# EAGLE design button_mux (EAGLE 9.6.2)
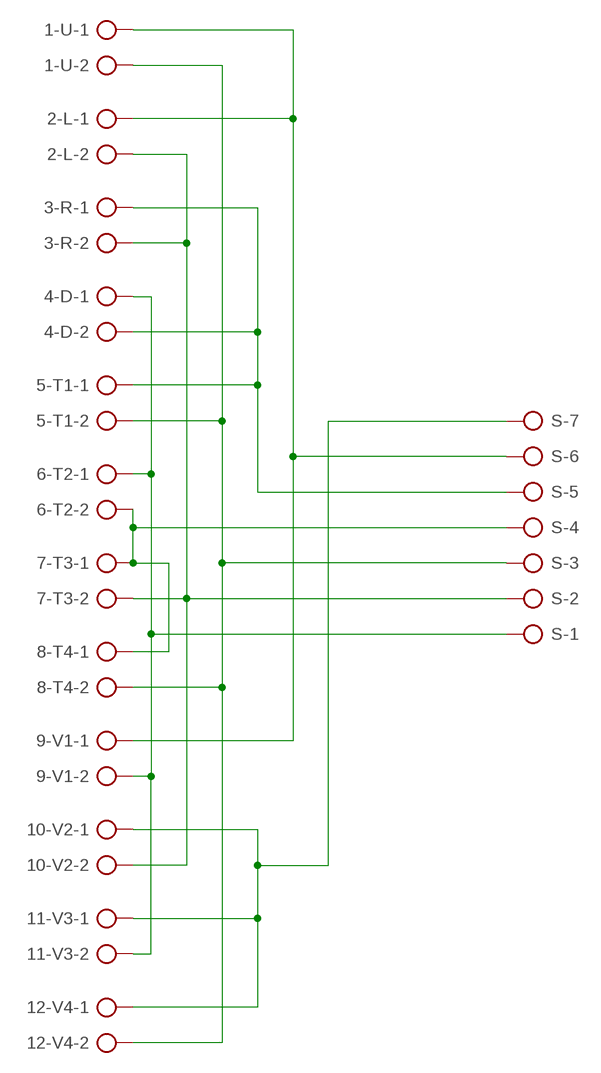
[diagram p0: schematic, sheet 1]

## Parts
1-U  AK300/2  [AK300/2]
2-L  AK300/2  [AK300/2]
3-R  AK300/2  [AK300/2]
4-D  AK300/2  [AK300/2]
5-T1  AK300/2  [AK300/2]
6-T2  AK300/2  [AK300/2]
7-T3  AK300/2  [AK300/2]
8-T4  AK300/2  [AK300/2]
9-V1  AK300/2  [AK300/2]
10-V2  AK300/2  [AK300/2]
11-V3  AK300/2  [AK300/2]
12-V4  AK300/2  [AK300/2]
S  AK300/7  [AK300/7]

## Nets
N$1: 4-D.1 6-T2.1 9-V1.2 11-V3.2 S.1
N$2: 2-L.2 3-R.2 7-T3.2 10-V2.2 S.2
N$3: 1-U.2 5-T1.2 8-T4.2 12-V4.2 S.3
N$4: 6-T2.2 7-T3.1 8-T4.1 S.4
N$5: 3-R.1 4-D.2 5-T1.1 S.5
N$6: 1-U.1 2-L.1 9-V1.1 S.6
N$7: 10-V2.1 11-V3.1 12-V4.1 S.7

## Library data of the parts
1-U 2-L 3-R 4-D 5-T1 6-T2 7-T3 8-T4 9-V1 10-V2 11-V3 12-V4 = con-ptr500:AK300/2: CONNECTOR; OC_FARNELL: unknown; OC_NEWARK: unknown
S = con-ptr500:AK300/7: CONNECTOR; OC_FARNELL: unknown; OC_NEWARK: unknown

## Board
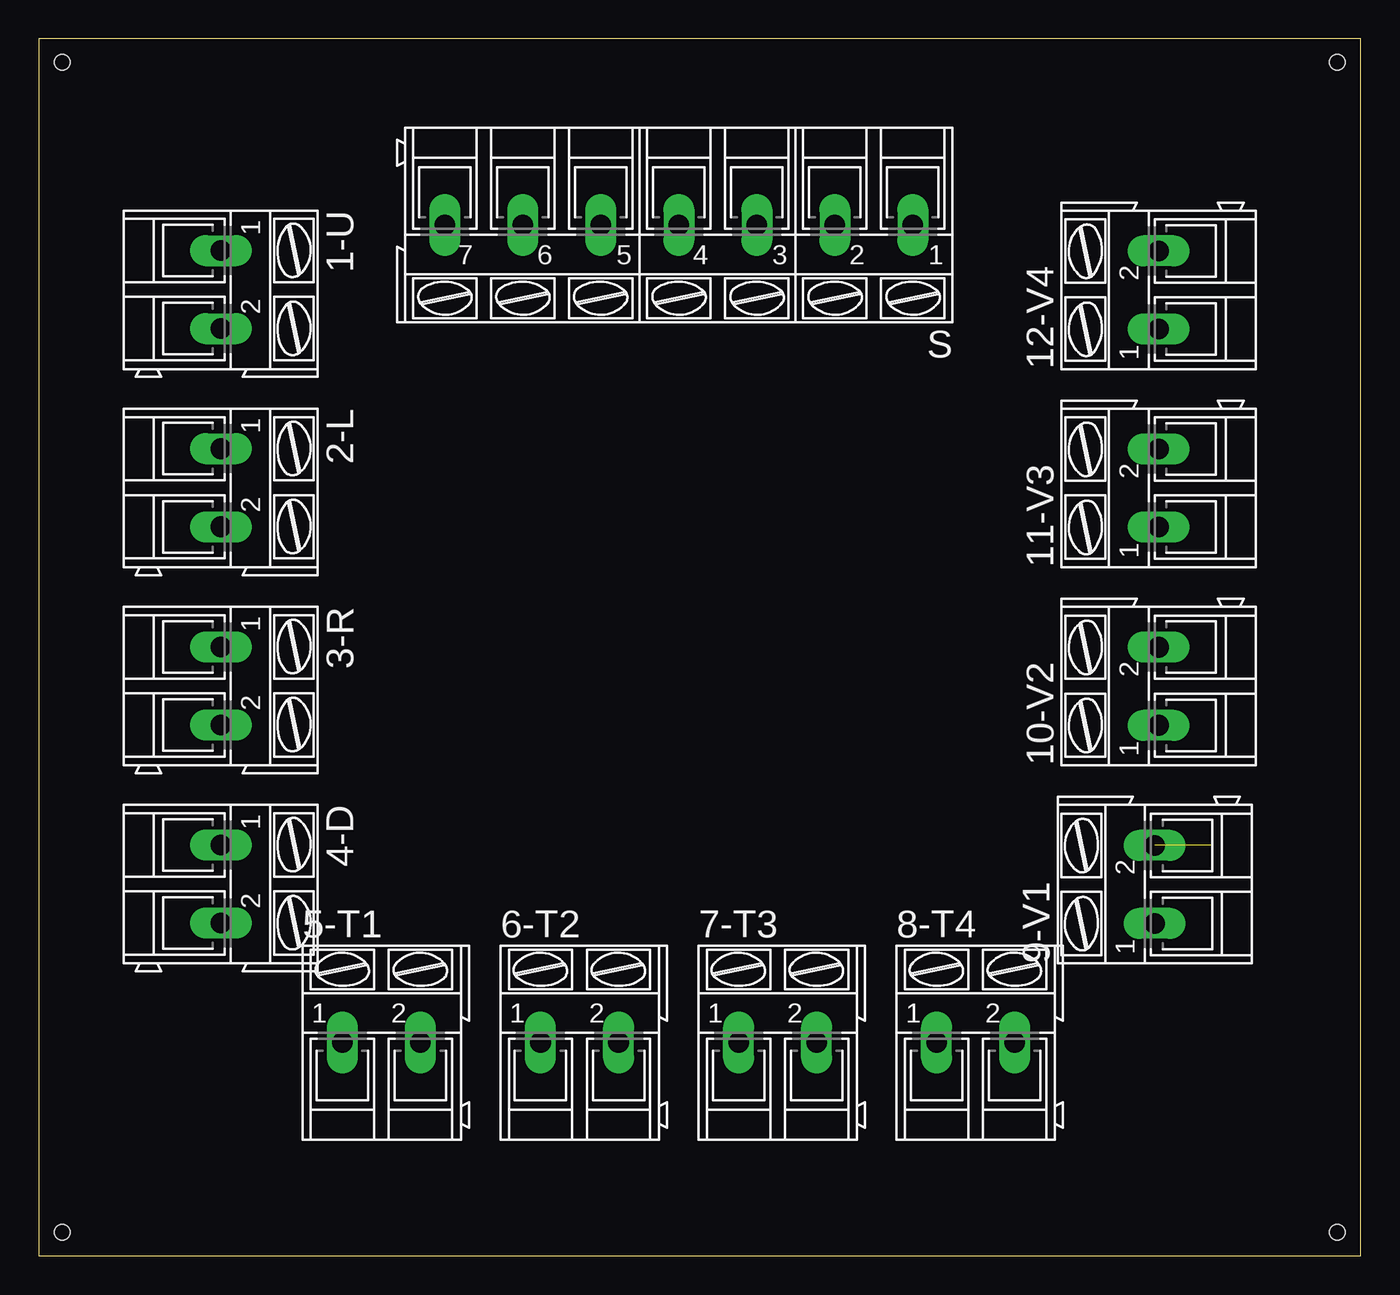
[diagram p1: board, top side]
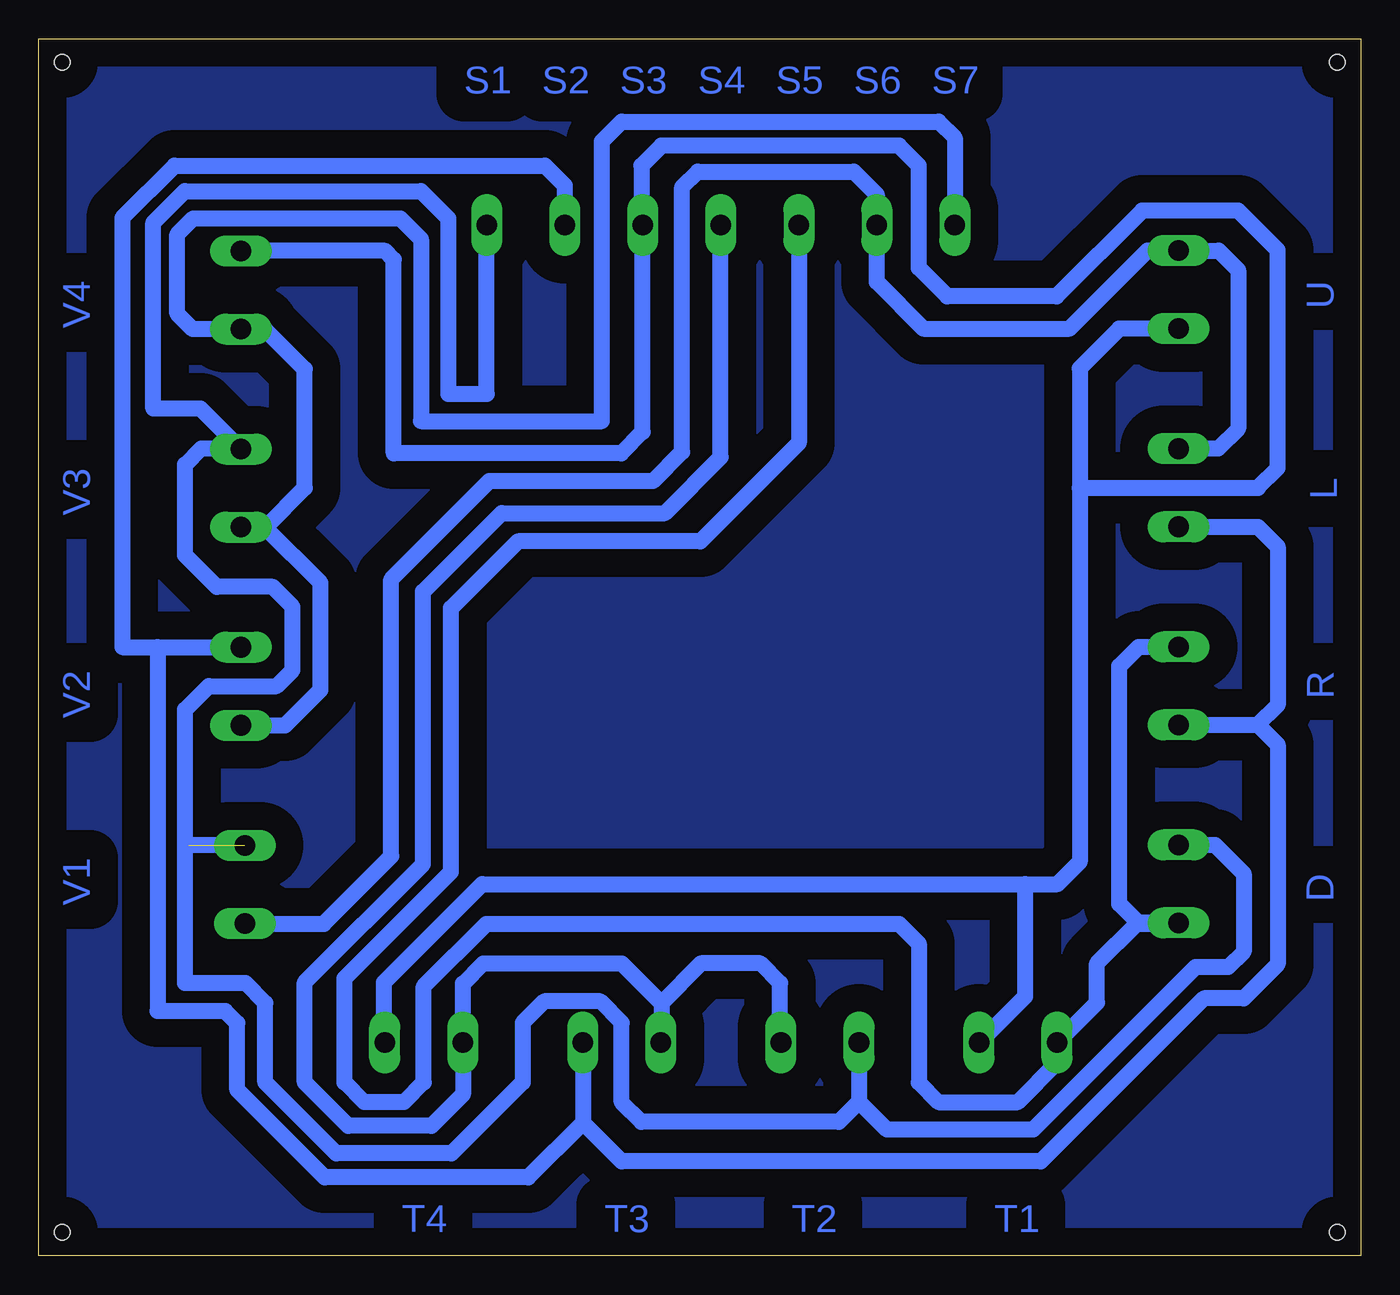
[diagram p2: board, bottom side, seen from below]

Size 84.75 x 78 mm. Coordinates in mm from the lower left corner, seen from the top.
Outline: 0,0 84.75,0 84.75,78 0,78 0,0
Copper layers (1*16): Top 0.035mm / dielectric 1.5mm / Bottom 0.035mm
Design rules "default": minimum track width 6mil, minimum drill 0.35mm, track to track 6mil, track to pad 6mil, pad to pad 6mil, via to via 6mil, smd to smd 6mil, copper to edge 40mil, drill to drill 6mil, minimum pad ring 10mil, minimum via ring 8mil, stop-mask expansion 4mil, vias tented up to drill 0mil, thermal gap 10mil
Holes 1 mm at 1.5,76.5 1.5,1.5 83.25,1.5 83.25,76.5

### Footprints (pad centres in the part's own frame; a part is rotated, then mirrored left to right if it is on the bottom)
AK300/2 = drill 1.321 long: 1 -2.515,0; 2 2.489,0
AK300/7 = drill 1.321 long: 1 -15.011,0; 2 -10.008,0; 3 -5.004,0; 4 0,0; 5 5.004,0; 6 10.008,0; 7 15.011,0

### Placement (x,y rotation side)
1-U  11.66,61.92 270 top
2-L  11.66,49.22 270 top
3-R  11.66,36.52 270 top
4-D  11.66,23.82 270 top
5-T1  21.98,13.66 0 top
6-T2  34.68,13.66 0 top
7-T3  47.38,13.66 0 top
8-T4  60.08,13.66 0 top
9-V1  71.55,23.82 90 top
10-V2  71.8,36.52 90 top
11-V3  71.8,49.22 90 top
12-V4  71.8,61.92 90 top
S  41.03,66.08 180 top

### Tracks (layer width: path | path; a pad name or v marks a point on that pad's centre or on a via)
N$1  (1 unrouted)
  Bottom 1.016: 6-T2.1 32.16,9.88 | 32.16,9.88 30.37,8.08 21,8.08 10.58,18.5 8.5,18.5 7.5,19.5 7.5,24.5 9.34,26.34 4-D.1 | 32.16,9.88 33.46,8.58 46.11,8.58 47.38,9.85 47.38,14.93 48.75,16.3 52.36,16.3 53.73,14.93 53.73,11.12 58.29,6.56 65.68,6.56 70.24,11.12 70.24,16.2 71.51,17.47 75.38,17.47 75.38,26.07 75.14,26.31 | 9-V1.2 75.38,26.31 75.38,35 73.86,36.52 69.51,36.52 68.49,37.54 68.49,41.6 69.76,42.87 73.34,42.87 75.38,44.91 75.38,50.72 74.34,51.76 71.85,51.76 11-V3.2 74.39,54.3 77.42,54.3 77.42,66.23 75.4,68.25 60.25,68.25 58.5,66.5 58.5,55.25 56.04,55.25 S.1
N$2
  Bottom 1.016: 2-L.2 6.58,46.73 5.31,45.46 5.31,35.3 6.58,34.03 | 3-R.2 6.58,34.03 | 6.58,34.03 5.31,32.76 5.31,18.69 7.5,16.5 10.04,16.5 20.5,6.04 47.38,6.04 49.87,8.53 | 7-T3.2 49.87,8.53 | 49.87,8.53 53.37,5.02 66.43,5.02 72.03,10.62 72.03,14.91 72.8,15.68 77.15,15.68 77.15,39.01 | S.2 51.04,68.62 52.31,69.89 76.05,69.89 79.4,66.54 79.4,39.01 77.15,39.01 | 77.15,39.01 10-V2.2
N$3
  Bottom 1.016: 1-U.2 15.47,59.43 18.01,56.89 18.01,49.22 | 18.01,49.22 18.01,25.25 19.44,23.82 21.5,23.82 | 8-T4.2 62.62,13.71 62.62,17.53 56.33,23.82 21.5,23.82 | 12-V4.2 62.55,64.41 62,63.86 62,51.44 47.4,51.44 46.03,52.81 S.3 46.11,66.16 46.11,69.89 44.84,71.16 29.6,71.16 28.33,69.89 28.33,63.33 26.5,61.5 19.5,61.5 14,67 7.85,67 5.31,64.46 5.31,50.49 6.58,49.22 18.01,49.22 | 5-T1.2 21.5,16.63 21.5,23.82
N$4
  Bottom 1.016: 44.84,16.2 47.38,18.74 56.27,18.74 57.56,17.45 8-T4.1 57.56,10.35 59.58,8.33 64.91,8.33 67.7,11.12 67.7,17.53 60.12,25.11 60.12,42.57 55.08,47.61 44.61,47.61 41.03,51.19 S.4 | 7-T3.1 44.84,13.69 44.84,16.2 | 6-T2.2 37.22,13.71 37.22,17.47 38.49,18.74 42.3,18.74 44.84,16.2
N$5
  Bottom 1.016: S.5 36.03,52.11 42.34,45.8 54.04,45.8 58.33,41.51 58.33,24.61 65.16,17.78 65.16,11.12 63.89,9.85 61.35,9.85 60.08,11.12 60.08,17.26 56.06,21.28 29.6,21.28 28.33,20.01 28.33,11.12 27.06,9.85 21.98,9.85 19.46,12.37 5-T1.1 16.9,16.23 16.9,18.74 14.36,21.28 11.71,21.28 4-D.2 14.25,21.33 15.47,22.55 15.47,37.79 14.22,39.03 3-R.1
N$6
  Bottom 1.016: 2-L.1 9.14,51.73 7.85,53.03 7.85,63.19 9.1,64.44 1-U.1 13.66,64.44 18.66,59.44 28.04,59.44 31.02,62.42 S.6 | 9-V1.1 71.53,21.28 66.49,21.28 62.16,25.61 62.16,43.36 55.87,49.65 45.38,49.65 43.5,51.53 43.5,68.5 42.5,69.5 32.5,69.5 31.02,68.02 S.6 | 31.02,67.5 S.6
N$7
  Bottom 1.016: 10-V2.1 68.97,34.01 66.7,36.27 66.7,43.14 70.27,46.7 11-V3.1 70.22,46.7 67.7,49.22 67.7,56.84 70.27,59.41 12-V4.1 74.89,59.41 75.88,60.4 75.88,65.48 74.86,66.5 61.58,66.5 60.25,65.17 60.25,53.5 48.65,53.5 48.65,71.43 47.38,72.7 27.06,72.7 26.02,71.66 S.7
PCB
  pour Bottom (isolate 1.778): 0,78 0,0 84.75,0 84.75,78

### Text on the board
Bottom: S7 | S6 | S5 | S4 | S3 | S2 | S1 | U | V4 | V3 | L | R | V2 | V1 | D | T1 | T2 | T3 | T4